# Altium schematic sheet Load9.SchDoc
size A4; SheetNumber: 12; SheetTotal: 15
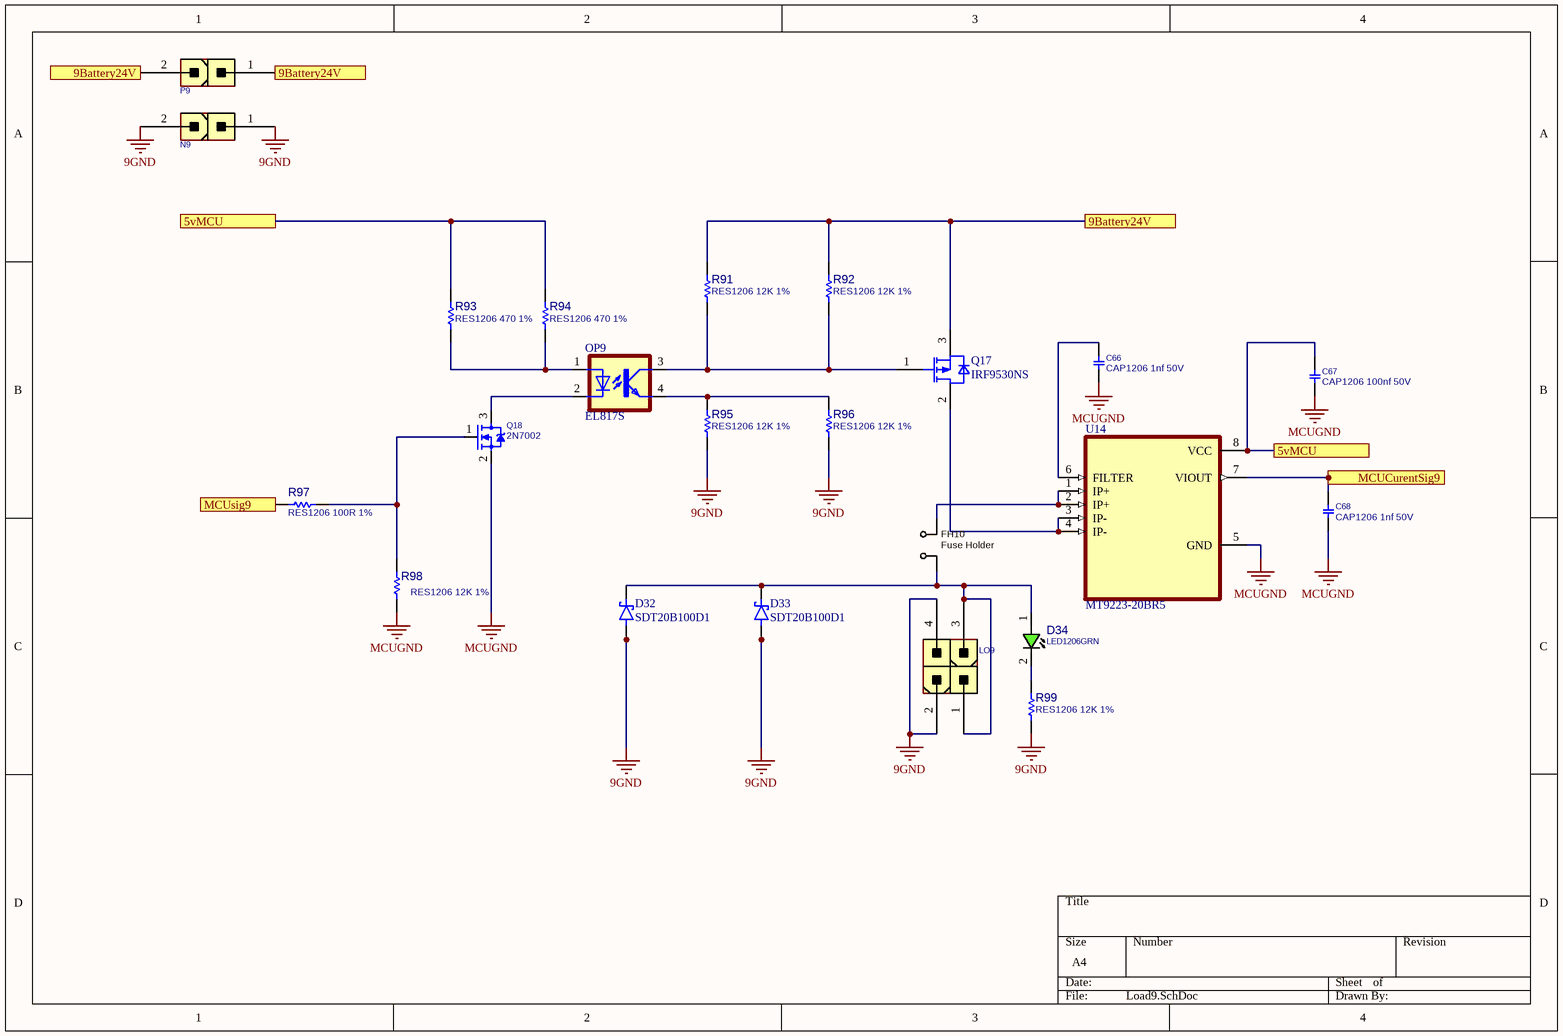
[diagram p0: Load9.SchDoc]

## Parts
C66  CAP1206 1nf 50V  [C1206]
C67  CAP1206 100nf 50V  [C1206]
C68  CAP1206 1nf 50V  [C1206]
D32  SDT20B100D1  [DPAK229P990X238-3N]
D33  SDT20B100D1  [DPAK229P990X238-3N]
D34  LED1206GRN  [LED1206GRN]
FH10  Fuse Holder  [FH_24101812]
LO9  CONN_ATXPWR_4  [ATXPWR_4]  (value not drawn)
N9  CONN_ATXPWR_2  [ATXPWR_2]  (value not drawn)
OP9  EL817S  [SOIC254P1030X460-4N]
P9  CONN_ATXPWR_2  [ATXPWR_2]  (value not drawn)
Q17  IRF9530NS  [TO254P1528X508-4_3N-V1]
Q18  2N7002  [SOT23_3]
R91  RES1206 12K 1%  [R1206]
R92  RES1206 12K 1%  [R1206]
R93  RES1206 470 1%  [R1206]
R94  RES1206 470 1%  [R1206]
R95  RES1206 12K 1%  [R1206]
R96  RES1206 12K 1%  [R1206]
R97  RES1206 100R 1%  [R1206]
R98  RES1206 12K 1%  [R1206]
R99  RES1206 12K 1%  [R1206]
U14  MT9223-20BR5  [SOIC127P600X175-8N]

## Ports
5vMCU, 9Battery24V, MCUCurentSig9, MCUsig9

## Nets
9GND: D32.1(A) D32.3(A__1) D33.1(A) D33.3(A__1) LO9.2 LO9.4 N9.1 N9.2 R95.2 R96.2 R99.2
MCUGND: C66.2 C67.2 C68.2 Q18.2(SOURCE) R98.2 U14.5(GND)
5vMCU: C67.1 R93.2 R94.2 U14.8(VCC) ; port 5vMCU
9Battery24V: P9.1 P9.2 Q17.3(SOURCE) R91.1 R92.1 ; port 9Battery24V
MCUCurentSig9: C68.1 U14.7(VIOUT) ; port MCUCurentSig9
MCUsig9: R97.1 ; port MCUsig9
NetC66_1: C66.1 U14.6(FILTER)
NetD32_4: D32.4(K) D33.4(K) D34.1(ANODE) FH10.1 LO9.1 LO9.3
NetD34_2: D34.2(CATHODE) R99.1
NetFH10_2: FH10.2 U14.1(IP+) U14.2(IP+)
NetOP9_1: OP9.1(A) R93.1 R94.1
NetOP9_2: OP9.2(C) Q18.3(DRAIN)
NetOP9_3: OP9.3(COL) Q17.1(GATE) R91.2 R92.2
NetOP9_4: OP9.4(EMIT) R95.1 R96.1
NetQ17_2: Q17.2(DRAIN) U14.3(IP-) U14.4(IP-)
NetQ18_1: Q18.1(GATE) R97.2 R98.1

## Library data of the parts
C66-C68 = CAP_SMD_MLCC_1206: CAP, MLCC; PARAM: -, -%; MANF_P#: MANF_PART#; PARAM2: -V; PRICE: 100= 1$; MANF: -; ASSEMBLY: ASSEMBLY
D32 D33 = MBRD835L: Diode Schottky 35 V 8A Surface Mount DPAK; MF: ON Semiconductor; SnapEDA_Link: https://www.snapeda.com/parts/MBRD835L/Onsemi/view-part/?ref=snap; Package: TO-252-3 MICROSS/On Semiconductor; Value: *; MP: MBRD835L; Check_prices: https://www.snapeda.com/parts/MBRD835L/Onsemi/view-part/?ref=eda
D34 = LED_SMD_1206_GRN: LED, SMD, 1206, GREEN; PARAM: 20mA; DESC: DESCRIPTION; PARAM2: 2.2V; MANF: -; ASSEMBLY: ASSEMBLY; PRICE: 36t@Javan; MANF_P#: -; VALUE: LED1206GRN; MountType: SMT; PartType: LED
FH10 = FUSE_SMD_HOLDER_24101812: Fuse SMD2410 Holder; PARAM: max. 10A; MANF: Littelfuse; MANF_P#: 01550900M; PARAM2: 125v; PRICE: 0.2$; PACKAGE: SMD,5.0x9.7mm; VALUE: Fuse Holder
LO9 = CONN_ATXPWR_4: CONN, ATX POWER, 4 P; MANF: TE, Molex; MANF_P#: 4-1775099-0, 39281043; VALUE: CONN_ATXPWR_4; MountType: THD; PACKAGE: ATXPWR-4pin; Part Type: Conn.
N9 P9 = CONN_ATXPWR_2: CONN, ATX POWER, 2 P; MANF: Molex; MANF_P#: 39281023; VALUE: CONN_ATXPWR_2; MountType: THD; PACKAGE: ATXPWR-2pin; Part Type: Conn.
OP9 = EL817S: Optoisolator Transistor Output 5000Vrms 1 Channel 4-SMD; MF: Everlight Electronics; SnapEDA_Link: https://www.snapeda.com/parts/EL817S/Everlight+Electronics+Co+Ltd/view-part/?ref=snap; Package: SMD-4 Everlight Electronics Co Ltd; Value: *; MP: EL817S; Check_prices: https://www.snapeda.com/parts/EL817S/Everlight+Electronics+Co+Ltd/view-part/?ref=eda
Q17 = IRF9530NS: OptiMOS - P2 Power-Transistor, P-channel-Enhancement mode, VDS -30V; Manufacturer: Infineon Technologies; Manufacturer Order NumberManufacturer Order Number: IRF9530NS; PackageReference: PG-TO263-3-901
Q18 = MOSN_2N7002_SOT23: MOSFET, N-CH, 60V, 0.3A; MANF: NXP; ASSEMBLY: ASSEMBLY; MANF_P#: 2N7002; PARAM2: 60v; PARAM: 0.3A; PRICE: 0.3t@Javan; VALUE: 2N7002
R91-R99 = RES_SMD_1206: RESISTOR, SMD; PARAM: 1%, 0.25W; DESC: DESCRIPTION; DIST#: MOUSER; MANF_P#: -; MANF: -; ASSEMBLY: ASSEMBLY; PRICE: -; PARAM2: -
U14 = ACS712ELCTR-05B-T: MF: {'manufacturer': u'Allegro MicroSystems'}; Package: None; Price: None; Value: *; MP: ACS712ELCTR-05B-T; Availability: Unavailable